# Altium project Main_Board.PrjPcb (part 27 of 44)

## Sheet RAM.SchDoc: RAM
size A3; Organization: PnP Systems Sp. z o.o.; Address1: Jasionka 954; Address2: 36-002  Jasionka, Poland; Address3: Phone: +48 17 773 69 10; Address4: e-mail: info@pnpsystems.com.pl
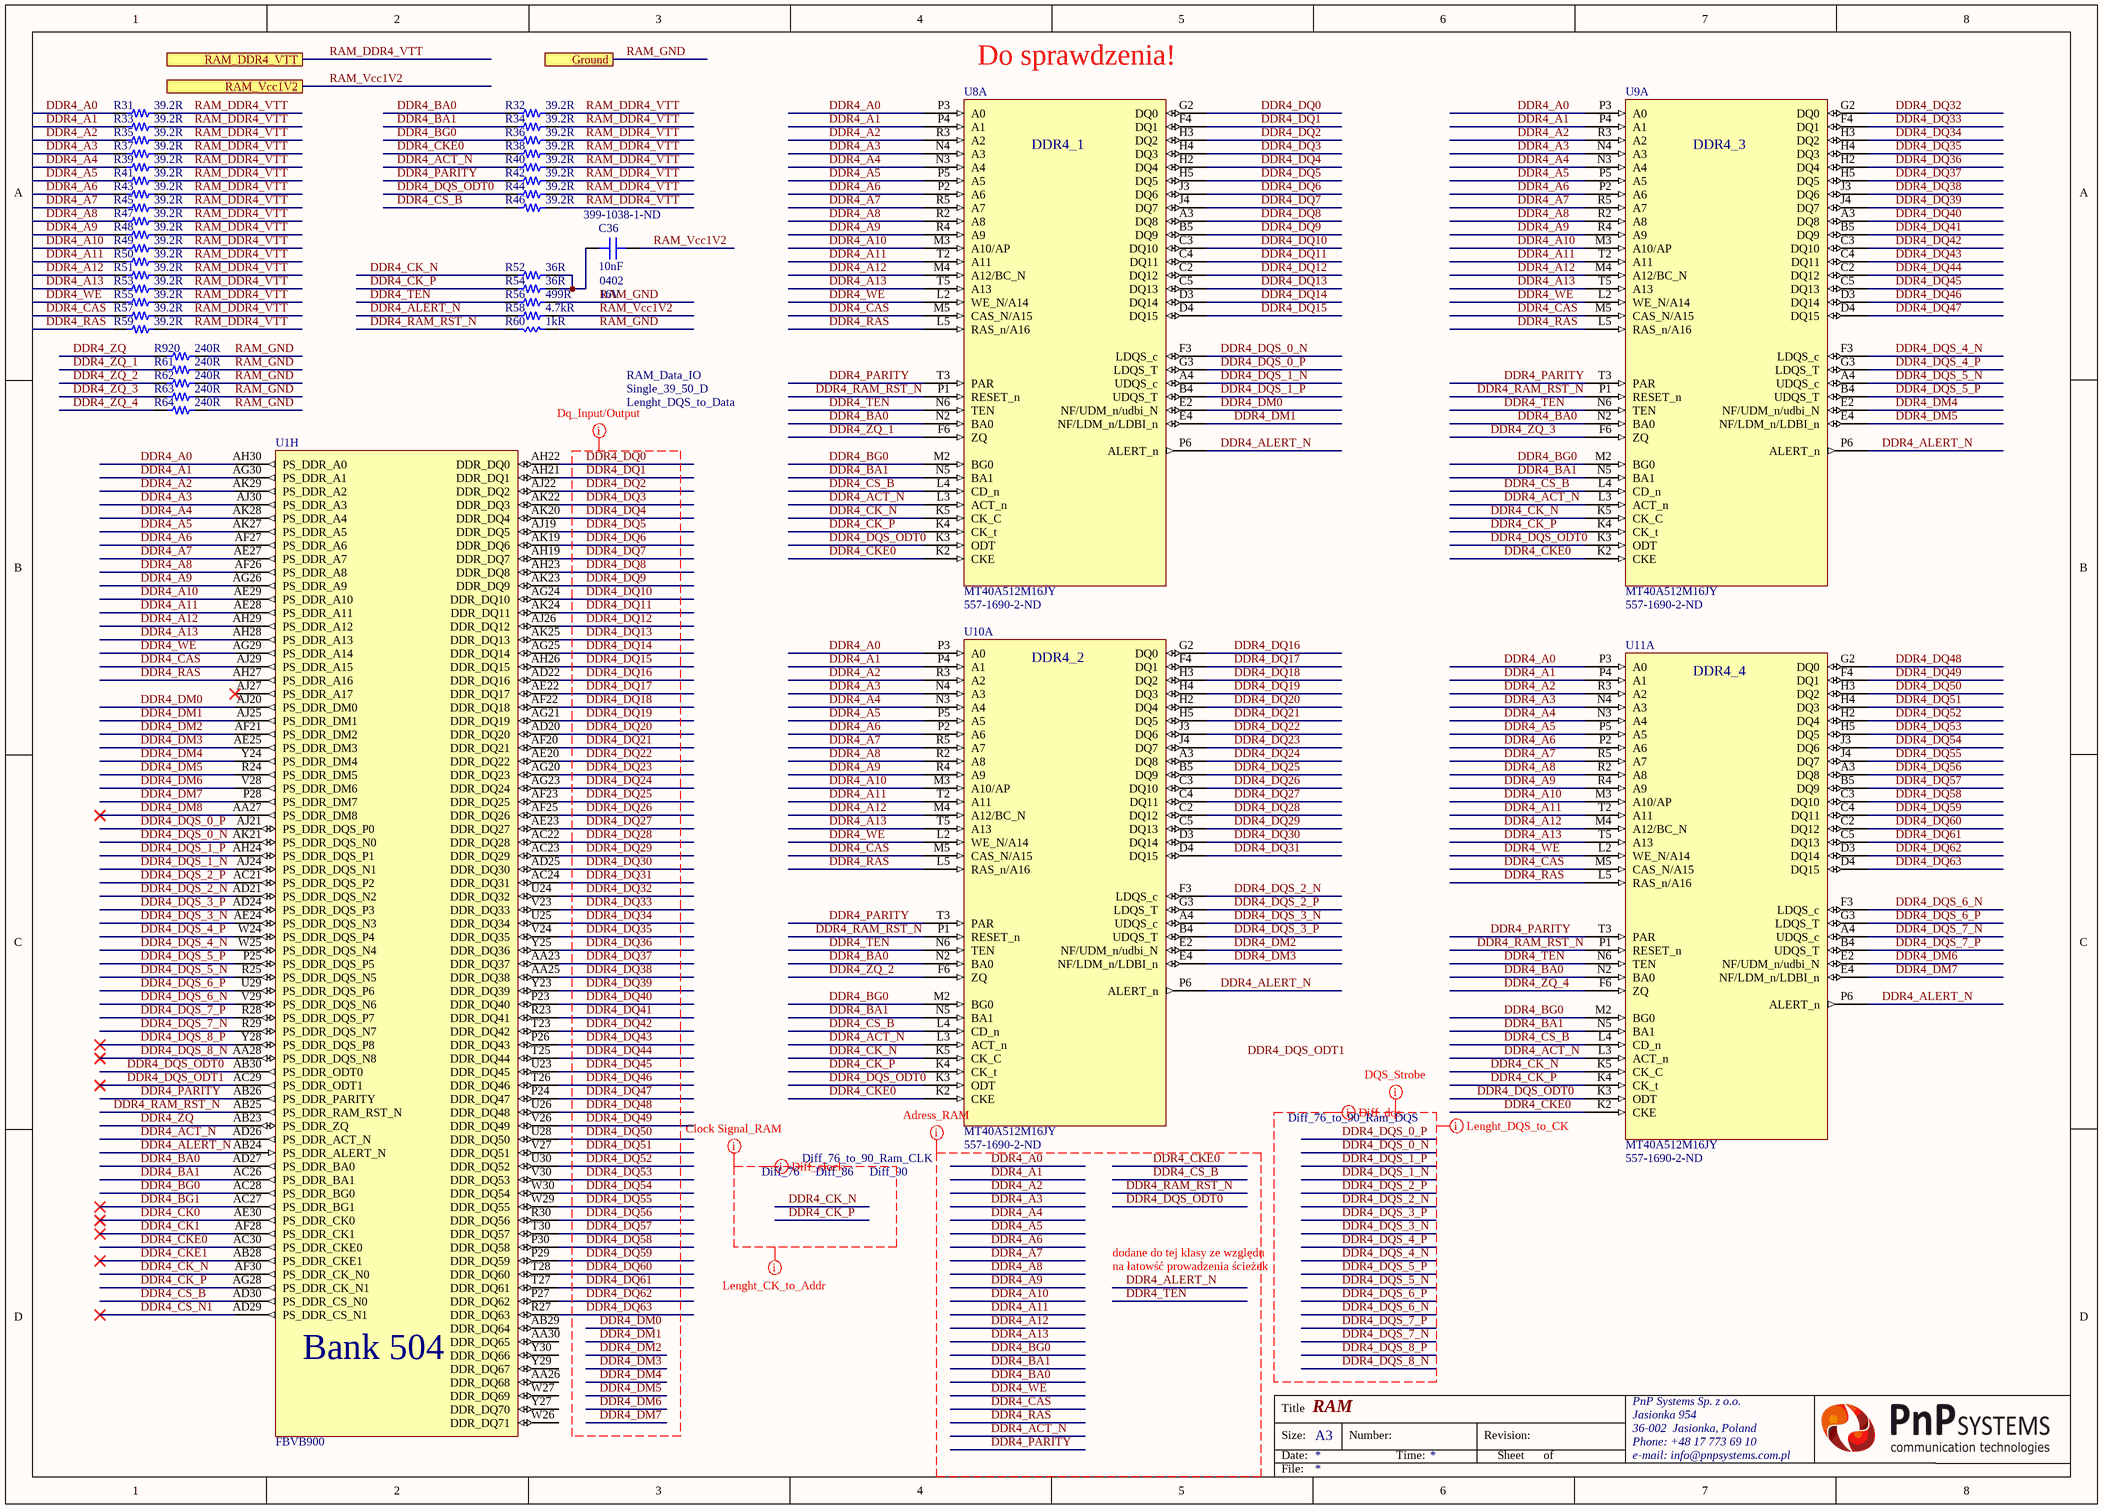
[diagram p37: RAM.SchDoc]

### Parts
C36  10nF  Supplier Part Number 1: 399-1038-1-ND  Case/Package: 0402  Voltage Rating (DC): 16V  [CAP 0402/1005 KK]
R31  39.2R  [RES 0402/1005 RF KK]
R32  39.2R  [RES 0402/1005 RF KK]
R33  39.2R  [RES 0402/1005 RF KK]
R34  39.2R  [RES 0402/1005 RF KK]
R35  39.2R  [RES 0402/1005 RF KK]
R36  39.2R  [RES 0402/1005 RF KK]
R37  39.2R  [RES 0402/1005 RF KK]
R38  39.2R  [RES 0402/1005 RF KK]
R39  39.2R  [RES 0402/1005 RF KK]
R40  39.2R  [RES 0402/1005 RF KK]
R41  39.2R  [RES 0402/1005 RF KK]
R42  39.2R  [RES 0402/1005 RF KK]
R43  39.2R  [RES 0402/1005 RF KK]
R44  39.2R  [RES 0402/1005 RF KK]
R45  39.2R  [RES 0402/1005 RF KK]
R46  39.2R  [RES 0402/1005 RF KK]
R47  39.2R  [RES 0402/1005 RF KK]
R48  39.2R  [RES 0402/1005 RF KK]
R49  39.2R  [RES 0402/1005 RF KK]
R50  39.2R  [RES 0402/1005 RF KK]
R51  39.2R  [RES 0402/1005 RF KK]
R52  36R  [RES 0402/1005 RF KK]
R53  39.2R  [RES 0402/1005 RF KK]
R54  36R  [RES 0402/1005 RF KK]
R55  39.2R  [RES 0402/1005 RF KK]
R56  499R  [RES 0402/1005 RF KK]
R57  39.2R  [RES 0402/1005 RF KK]
R58  4.7kR  [RES 0402/1005 RF KK]
R59  39.2R  [RES 0402/1005 RF KK]
R60  1kR  [RES 0402/1005 RF KK]
R61  240R  [RES 0402/1005 RF KK]
R62  240R  [RES 0402/1005 RF KK]
R63  240R  [RES 0402/1005 RF KK]
R64  240R  [RES 0402/1005 RF KK]
R920  240R  [RES 0402/1005 RF KK]
U1  FBVB900  [FBVB900 XX]  (part H of 23)
U8  MT40A512M16JY  Supplier Part Number 1: 557-1690-2-ND  [MT40A512M16JY]  (part A of 2)
U9  MT40A512M16JY  Supplier Part Number 1: 557-1690-2-ND  [MT40A512M16JY]  (part A of 2)
U10  MT40A512M16JY  Supplier Part Number 1: 557-1690-2-ND  [MT40A512M16JY]  (part A of 2)
U11  MT40A512M16JY  Supplier Part Number 1: 557-1690-2-ND  [MT40A512M16JY]  (part A of 2)

### Ports
Ground, RAM_DDR4_VTT, RAM_Vcc1V2

### Nets
RAM_GND: R56.2 R60.2 R61.2 R62.2 R63.2 R64.2 R920.2 ; port Ground  [project net B503_Ground]
DDR4_A0: R31.1 U1.AH30(PS_DDR_A0) U8.P3(A0) U9.P3(A0) U10.P3(A0) U11.P3(A0)
DDR4_A1: R33.1 U1.AG30(PS_DDR_A1) U8.P4(A1) U9.P4(A1) U10.P4(A1) U11.P4(A1)
DDR4_A2: R35.1 U1.AK29(PS_DDR_A2) U8.R3(A2) U9.R3(A2) U10.R3(A2) U11.R3(A2)
DDR4_A3: R37.1 U1.AJ30(PS_DDR_A3) U8.N4(A3) U9.N4(A3) U10.N4(A3) U11.N4(A3)
DDR4_A4: R39.1 U1.AK28(PS_DDR_A4) U8.N3(A4) U9.N3(A4) U10.N3(A4) U11.N3(A4)
DDR4_A5: R41.1 U1.AK27(PS_DDR_A5) U8.P5(A5) U9.P5(A5) U10.P5(A5) U11.P5(A5)
DDR4_A6: R43.1 U1.AF27(PS_DDR_A6) U8.P2(A6) U9.P2(A6) U10.P2(A6) U11.P2(A6)
DDR4_A7: R45.1 U1.AE27(PS_DDR_A7) U8.R5(A7) U9.R5(A7) U10.R5(A7) U11.R5(A7)
DDR4_A8: R47.1 U1.AF26(PS_DDR_A8) U8.R2(A8) U9.R2(A8) U10.R2(A8) U11.R2(A8)
DDR4_A9: R48.1 U1.AG26(PS_DDR_A9) U8.R4(A9) U9.R4(A9) U10.R4(A9) U11.R4(A9)
DDR4_A10: R49.1 U1.AE29(PS_DDR_A10) U8.M3(A10/AP) U9.M3(A10/AP) U10.M3(A10/AP) U11.M3(A10/AP)
DDR4_A11: R50.1 U1.AE28(PS_DDR_A11) U8.T2(A11) U9.T2(A11) U10.T2(A11) U11.T2(A11)
DDR4_A12: R51.1 U1.AH29(PS_DDR_A12) U8.M4(A12/BC_N) U9.M4(A12/BC_N) U10.M4(A12/BC_N) U11.M4(A12/BC_N)
DDR4_A13: R53.1 U1.AH28(PS_DDR_A13) U8.T5(A13) U9.T5(A13) U10.T5(A13) U11.T5(A13)
DDR4_ACT_N: R40.1 U1.AD26(PS_DDR_ACT_N) U8.L3(ACT_n) U9.L3(ACT_n) U10.L3(ACT_n) U11.L3(ACT_n)
DDR4_ALERT_N: R58.1 U1.AB24(PS_DDR_ALERT_N) U8.P6(ALERT_n) U9.P6(ALERT_n) U10.P6(ALERT_n) U11.P6(ALERT_n)
DDR4_BA0: R32.1 U1.AD27(PS_DDR_BA0) U8.N2(BA0) U9.N2(BA0) U10.N2(BA0) U11.N2(BA0)
DDR4_BA1: R34.1 U1.AC26(PS_DDR_BA1) U8.N5(BA1) U9.N5(BA1) U10.N5(BA1) U11.N5(BA1)
DDR4_BG0: R36.1 U1.AC28(PS_DDR_BG0) U8.M2(BG0) U9.M2(BG0) U10.M2(BG0) U11.M2(BG0)
DDR4_BG1: U1.AC27(PS_DDR_BG1)
DDR4_CAS: R57.1 U1.AJ29(PS_DDR_A15) U8.M5(CAS_N/A15) U9.M5(CAS_N/A15) U10.M5(CAS_N/A15) U11.M5(CAS_N/A15)
DDR4_CK0: U1.AE30(PS_DDR_CK0)
DDR4_CK1: U1.AF28(PS_DDR_CK1)
DDR4_CK_N: R52.1 U1.AF30(PS_DDR_CK_N0) U8.K5(CK_C) U9.K5(CK_C) U10.K5(CK_C) U11.K5(CK_C)
DDR4_CK_P: R54.1 U1.AG28(PS_DDR_CK_N1) U8.K4(CK_t) U9.K4(CK_t) U10.K4(CK_t) U11.K4(CK_t)
DDR4_CKE0: R38.1 U1.AC30(PS_DDR_CKE0) U8.K2(CKE) U9.K2(CKE) U10.K2(CKE) U11.K2(CKE)
DDR4_CKE1: U1.AB28(PS_DDR_CKE1)
DDR4_CS_B: R46.1 U1.AD30(PS_DDR_CS_N0) U8.L4(CD_n) U9.L4(CD_n) U10.L4(CD_n) U11.L4(CD_n)
DDR4_CS_N1: U1.AD29(PS_DDR_CS_N1)
DDR4_DM0: U1.AJ20(PS_DDR_DM0) U8.E2(NF/UDM_n/udbi_N)
DDR4_DM1: U1.AJ25(PS_DDR_DM1) U8.E4(NF/LDM_n/LDBI_n)
DDR4_DM2: U1.AF21(PS_DDR_DM2) U10.E2(NF/UDM_n/udbi_N)
DDR4_DM3: U1.AE25(PS_DDR_DM3) U10.E4(NF/LDM_n/LDBI_n)
DDR4_DM4: U1.Y24(PS_DDR_DM4) U9.E2(NF/UDM_n/udbi_N)
DDR4_DM5: U1.R24(PS_DDR_DM5) U9.E4(NF/LDM_n/LDBI_n)
DDR4_DM6: U1.V28(PS_DDR_DM6) U11.E2(NF/UDM_n/udbi_N)
DDR4_DM7: U1.P28(PS_DDR_DM7) U11.E4(NF/LDM_n/LDBI_n)
DDR4_DM8: U1.AA27(PS_DDR_DM8)
DDR4_DQ0: U1.AH22(DDR_DQ0) U8.G2(DQ0)
DDR4_DQ1: U1.AH21(DDR_DQ1) U8.F4(DQ1)
DDR4_DQ2: U1.AJ22(DDR_DQ2) U8.H3(DQ2)
DDR4_DQ3: U1.AK22(DDR_DQ3) U8.H4(DQ3)
DDR4_DQ4: U1.AK20(DDR_DQ4) U8.H2(DQ4)
DDR4_DQ5: U1.AJ19(DDR_DQ5) U8.H5(DQ5)
DDR4_DQ6: U1.AK19(DDR_DQ6) U8.J3(DQ6)
DDR4_DQ7: U1.AH19(DDR_DQ7) U8.J4(DQ7)
DDR4_DQ8: U1.AH23(DDR_DQ8) U8.A3(DQ8)
DDR4_DQ9: U1.AK23(DDR_DQ9) U8.B5(DQ9)
DDR4_DQ10: U1.AG24(DDR_DQ10) U8.C3(DQ10)
DDR4_DQ11: U1.AK24(DDR_DQ11) U8.C4(DQ11)
DDR4_DQ12: U1.AJ26(DDR_DQ12) U8.C2(DQ12)
DDR4_DQ13: U1.AK25(DDR_DQ13) U8.C5(DQ13)
DDR4_DQ14: U1.AG25(DDR_DQ14) U8.D3(DQ14)
DDR4_DQ15: U1.AH26(DDR_DQ15) U8.D4(DQ15)
DDR4_DQ16: U1.AD22(DDR_DQ16) U10.G2(DQ0)
DDR4_DQ17: U1.AE22(DDR_DQ17) U10.F4(DQ1)
DDR4_DQ18: U1.AF22(DDR_DQ18) U10.H3(DQ2)
DDR4_DQ19: U1.AG21(DDR_DQ19) U10.H4(DQ3)
DDR4_DQ20: U1.AD20(DDR_DQ20) U10.H2(DQ4)
DDR4_DQ21: U1.AF20(DDR_DQ21) U10.H5(DQ5)
DDR4_DQ22: U1.AE20(DDR_DQ22) U10.J3(DQ6)
DDR4_DQ23: U1.AG20(DDR_DQ23) U10.J4(DQ7)
DDR4_DQ24: U1.AG23(DDR_DQ24) U10.A3(DQ8)
DDR4_DQ25: U1.AF23(DDR_DQ25) U10.B5(DQ9)
DDR4_DQ26: U1.AF25(DDR_DQ26) U10.C3(DQ10)
DDR4_DQ27: U1.AE23(DDR_DQ27) U10.C4(DQ11)
DDR4_DQ28: U1.AC22(DDR_DQ28) U10.C2(DQ12)
DDR4_DQ29: U1.AC23(DDR_DQ29) U10.C5(DQ13)
DDR4_DQ30: U1.AD25(DDR_DQ30) U10.D3(DQ14)
DDR4_DQ31: U1.AC24(DDR_DQ31) U10.D4(DQ15)
DDR4_DQ32: U1.U24(DDR_DQ32) U9.G2(DQ0)
DDR4_DQ33: U1.V23(DDR_DQ33) U9.F4(DQ1)
DDR4_DQ34: U1.U25(DDR_DQ34) U9.H3(DQ2)
DDR4_DQ35: U1.V24(DDR_DQ35) U9.H4(DQ3)
DDR4_DQ36: U1.Y25(DDR_DQ36) U9.H2(DQ4)
DDR4_DQ37: U1.AA23(DDR_DQ37) U9.H5(DQ5)
DDR4_DQ38: U1.AA25(DDR_DQ38) U9.J3(DQ6)
DDR4_DQ39: U1.Y23(DDR_DQ39) U9.J4(DQ7)
DDR4_DQ40: U1.P23(DDR_DQ40) U9.A3(DQ8)
DDR4_DQ41: U1.R23(DDR_DQ41) U9.B5(DQ9)
DDR4_DQ42: U1.T23(DDR_DQ42) U9.C3(DQ10)
DDR4_DQ43: U1.P26(DDR_DQ43) U9.C4(DQ11)
DDR4_DQ44: U1.T25(DDR_DQ44) U9.C2(DQ12)
DDR4_DQ45: U1.U23(DDR_DQ45) U9.C5(DQ13)
DDR4_DQ46: U1.T26(DDR_DQ46) U9.D3(DQ14)
DDR4_DQ47: U1.P24(DDR_DQ47) U9.D4(DQ15)
DDR4_DQ48: U1.U26(DDR_DQ48) U11.G2(DQ0)
DDR4_DQ49: U1.V26(DDR_DQ49) U11.F4(DQ1)
DDR4_DQ50: U1.U28(DDR_DQ50) U11.H3(DQ2)
DDR4_DQ51: U1.V27(DDR_DQ51) U11.H4(DQ3)
DDR4_DQ52: U1.U30(DDR_DQ52) U11.H2(DQ4)
DDR4_DQ53: U1.V30(DDR_DQ53) U11.H5(DQ5)
DDR4_DQ54: U1.W30(DDR_DQ54) U11.J3(DQ6)
DDR4_DQ55: U1.W29(DDR_DQ55) U11.J4(DQ7)
DDR4_DQ56: U1.R30(DDR_DQ56) U11.A3(DQ8)
DDR4_DQ57: U1.T30(DDR_DQ57) U11.B5(DQ9)
DDR4_DQ58: U1.P30(DDR_DQ58) U11.C3(DQ10)
DDR4_DQ59: U1.P29(DDR_DQ59) U11.C4(DQ11)
DDR4_DQ60: U1.T28(DDR_DQ60) U11.C2(DQ12)
DDR4_DQ61: U1.T27(DDR_DQ61) U11.C5(DQ13)
DDR4_DQ62: U1.P27(DDR_DQ62) U11.D3(DQ14)
DDR4_DQ63: U1.R27(DDR_DQ63) U11.D4(DQ15)
DDR4_DQS_0_N: U1.AK21(PS_DDR_DQS_N0) U8.F3(LDQS_c)
DDR4_DQS_0_P: U1.AJ21(PS_DDR_DQS_P0) U8.G3(LDQS_T)
DDR4_DQS_1_N: U1.AJ24(PS_DDR_DQS_N1) U8.A4(UDQS_c)
DDR4_DQS_1_P: U1.AH24(PS_DDR_DQS_P1) U8.B4(UDQS_T)
DDR4_DQS_2_N: U1.AD21(PS_DDR_DQS_N2) U10.F3(LDQS_c)
DDR4_DQS_2_P: U1.AC21(PS_DDR_DQS_P2) U10.G3(LDQS_T)
DDR4_DQS_3_N: U1.AE24(PS_DDR_DQS_N3) U10.A4(UDQS_c)
DDR4_DQS_3_P: U1.AD24(PS_DDR_DQS_P3) U10.B4(UDQS_T)
DDR4_DQS_4_N: U1.W25(PS_DDR_DQS_N4) U9.F3(LDQS_c)
DDR4_DQS_4_P: U1.W24(PS_DDR_DQS_P4) U9.G3(LDQS_T)
DDR4_DQS_5_N: U1.R25(PS_DDR_DQS_N5) U9.A4(UDQS_c)
DDR4_DQS_5_P: U1.P25(PS_DDR_DQS_P5) U9.B4(UDQS_T)
DDR4_DQS_6_N: U1.V29(PS_DDR_DQS_N6) U11.F3(LDQS_c)
DDR4_DQS_6_P: U1.U29(PS_DDR_DQS_P6) U11.G3(LDQS_T)
DDR4_DQS_7_N: U1.R29(PS_DDR_DQS_N7) U11.A4(UDQS_c)
DDR4_DQS_7_P: U1.R28(PS_DDR_DQS_P7) U11.B4(UDQS_T)
DDR4_DQS_8_N: U1.AA28(PS_DDR_DQS_N8)
DDR4_DQS_8_P: U1.Y28(PS_DDR_DQS_P8)
DDR4_DQS_ODT0: R44.1 U1.AB30(PS_DDR_ODT0) U8.K3(ODT) U9.K3(ODT) U10.K3(ODT) U11.K3(ODT)
DDR4_DQS_ODT1: U1.AC29(PS_DDR_ODT1)
DDR4_PARITY: R42.1 U1.AB26(PS_DDR_PARITY) U8.T3(PAR) U9.T3(PAR) U10.T3(PAR) U11.T3(PAR)
DDR4_RAM_RST_N: R60.1 U1.AB25(PS_DDR_RAM_RST_N) U8.P1(RESET_n) U9.P1(RESET_n) U10.P1(RESET_n) U11.P1(RESET_n)
DDR4_RAS: R59.1 U1.AH27(PS_DDR_A16) U8.L5(RAS_n/A16) U9.L5(RAS_n/A16) U10.L5(RAS_n/A16) U11.L5(RAS_n/A16)
DDR4_TEN: R56.1 U8.N6(TEN) U9.N6(TEN) U10.N6(TEN) U11.N6(TEN)
DDR4_WE: R55.1 U1.AG29(PS_DDR_A14) U8.L2(WE_N/A14) U9.L2(WE_N/A14) U10.L2(WE_N/A14) U11.L2(WE_N/A14)
DDR4_ZQ: R920.1 U1.AB23(PS_DDR_ZQ)
DDR4_ZQ_1: R61.1 U8.F6(ZQ)
DDR4_ZQ_2: R62.1 U10.F6(ZQ)
DDR4_ZQ_3: R63.1 U9.F6(ZQ)
DDR4_ZQ_4: R64.1 U11.F6(ZQ)
RAM_DDR4_VTT: R31.2 R32.2 R33.2 R34.2 R35.2 R36.2 R37.2 R38.2 R39.2 R40.2 R41.2 R42.2 R43.2 R44.2 R45.2 R46.2 R47.2 R48.2 R49.2 R50.2 R51.2 R53.2 R55.2 R57.2 R59.2 ; port RAM_DDR4_VTT
RAM_Vcc1V2: C36.2 R58.2 ; port RAM_Vcc1V2
NetC36_1: C36.1 R52.2 R54.2

Not connected (* = marked no-connect by the designer): U1 AA26(DDR_DQ68) AA30(DDR_DQ65) AB29(DDR_DQ64) AJ27(PS_DDR_A17)* W26(DDR_DQ71) W27(DDR_DQ69) Y27(DDR_DQ70) Y29(DDR_DQ67) Y30(DDR_DQ66)

### Layout directives
net class RAM_Clock_Signal: DDR4_CK_N, DDR4_CK_P
differential pair; differential pair class Diff_76_to_90_Ram_CLK; differential pair class Diff_76; differential pair class Diff_86; differential pair class Diff_90: DDR4_CK_N, DDR4_CK_P
net class Single_36_39_50_Adr; net class RAM_Adress: DDR4_A0, DDR4_A1, DDR4_A2, DDR4_A3, DDR4_A4, DDR4_A5, DDR4_A6, DDR4_A7, DDR4_A8, DDR4_A9, DDR4_A10, DDR4_A11, DDR4_A12, DDR4_A13, DDR4_ACT_N, DDR4_ALERT_N, DDR4_BA0, DDR4_BA1, DDR4_BG0, DDR4_CAS, DDR4_CKE0, DDR4_CS_B, DDR4_DQS_ODT0, DDR4_PARITY, DDR4_RAM_RST_N, DDR4_RAS, DDR4_TEN, DDR4_WE
net class Diff_76_86_90; net class RAM_DQS_Strobe: DDR4_DQS_0_N, DDR4_DQS_0_P, DDR4_DQS_1_N, DDR4_DQS_1_P, DDR4_DQS_2_N, DDR4_DQS_2_P, DDR4_DQS_3_N, DDR4_DQS_3_P, DDR4_DQS_4_N, DDR4_DQS_4_P, DDR4_DQS_5_N, DDR4_DQS_5_P, DDR4_DQS_6_N, DDR4_DQS_6_P, DDR4_DQS_7_N, DDR4_DQS_7_P, DDR4_DQS_8_N, DDR4_DQS_8_P
net class Single_39_50_D; net class RAM_Data_IO; net class Lenght_DQS_to_Data: DDR4_DM0, DDR4_DM1, DDR4_DM2, DDR4_DM3, DDR4_DM4, DDR4_DM5, DDR4_DM6, DDR4_DM7, DDR4_DQ0, DDR4_DQ1, DDR4_DQ2, DDR4_DQ3, DDR4_DQ4, DDR4_DQ5, DDR4_DQ6, DDR4_DQ7, DDR4_DQ8, DDR4_DQ9, DDR4_DQ10, DDR4_DQ11, DDR4_DQ12, DDR4_DQ13, DDR4_DQ14, DDR4_DQ15, DDR4_DQ16, DDR4_DQ17, DDR4_DQ18, DDR4_DQ19, DDR4_DQ20, DDR4_DQ21, DDR4_DQ22, DDR4_DQ23, DDR4_DQ24, DDR4_DQ25, DDR4_DQ26, DDR4_DQ27, DDR4_DQ28, DDR4_DQ29, DDR4_DQ30, DDR4_DQ31, DDR4_DQ32, DDR4_DQ33, DDR4_DQ34, DDR4_DQ35, DDR4_DQ36, DDR4_DQ37, DDR4_DQ38, DDR4_DQ39, DDR4_DQ40, DDR4_DQ41, DDR4_DQ42, DDR4_DQ43, DDR4_DQ44, DDR4_DQ45, DDR4_DQ46, DDR4_DQ47, DDR4_DQ48, DDR4_DQ49, DDR4_DQ50, DDR4_DQ51, DDR4_DQ52, DDR4_DQ53, DDR4_DQ54, DDR4_DQ55, DDR4_DQ56, DDR4_DQ57, DDR4_DQ58, DDR4_DQ59, DDR4_DQ60, DDR4_DQ61, DDR4_DQ62, DDR4_DQ63
differential pair; differential pair class Diff_76_to_90_Ram_DQS: DDR4_DQS_0_N, DDR4_DQS_0_P, DDR4_DQS_1_N, DDR4_DQS_1_P, DDR4_DQS_2_N, DDR4_DQS_2_P, DDR4_DQS_3_N, DDR4_DQS_3_P, DDR4_DQS_4_N, DDR4_DQS_4_P, DDR4_DQS_5_N, DDR4_DQS_5_P, DDR4_DQS_6_N, DDR4_DQS_6_P, DDR4_DQS_7_N, DDR4_DQS_7_P, DDR4_DQS_8_N, DDR4_DQS_8_P
net class Lenght_CK_to_Addr: DDR4_CK_N, DDR4_CK_P
net class Lenght_DQS_to_CK: DDR4_DQS_0_N, DDR4_DQS_0_P, DDR4_DQS_1_N, DDR4_DQS_1_P, DDR4_DQS_2_N, DDR4_DQS_2_P, DDR4_DQS_3_N, DDR4_DQS_3_P, DDR4_DQS_4_N, DDR4_DQS_4_P, DDR4_DQS_5_N, DDR4_DQS_5_P, DDR4_DQS_6_N, DDR4_DQS_6_P, DDR4_DQS_7_N, DDR4_DQS_7_P, DDR4_DQS_8_N, DDR4_DQS_8_P

### Notes on the sheet
- (near U8) Do sprawdzenia!
- (near U8) DDR4_1
- (near U9) DDR4_3
- (near U10) DDR4_2
- (near U11) DDR4_4
- dodane do tej klasy ze względu
- na łatowść prowadzenia ścieżek
- Labels drawn without touching a wire or pin: DDR4_DQS_ODT1
- Title
- Size:
- Date:
- A3
- Number:
- Time:
- Revision:
- Sheet
- of
- File:
- (in symbol FBVB900, part H) Bank 504

### Library data of the parts
C36 = Capacitor: Manufacturer: KEMET; Manufacturer Part Number: C0402C103K4RACTU; Dielectric Material: Ceramic; Tolerance: 10%; Dielectric: X7R; Dissipation Factor: 3.5%; Supplier 1: Digi-Key; Stock 1: 1112674; Pricing 1: 1 = 0,10000, 10 = 0,02800, 100 = 0,01240, 500 = 0,00886, 1000 = 0,00696, 2500 = 0,00632, 5000 = 0,00582 (USD); RoHS: Yes; Mount: Surface Mount,PCB; Number of Pins: 2; Case Code (Metric): 1005; Case Code (Imperial): 0402; Contact Plating: Tin,Matte; Min Operating Temperature: -55°C; Max Operating Temperature: 125°C; Capacitance: 10nF; Packaging: Tape and Reel; Package Quantity: 1; Voltage Rating: 16V; Termination: SMD/SMT; Voltage: 16V; Length: 1mm; Height: 0.5mm; Width: 0.02inch; Depth: 0.5mm; Thickness: 0.022inch; Lead Pitch: 0.3mm; Radiation Hardening: No; REACH SVHC: No SVHC; ComponentLink1URL: https://datasheet.ciiva.com/14595/70095383-14595321.pdf?src-supplier=Allied+Electronics; ComponentLink1Description: https://datasheet.ciiva.com/14595/70095383-14595321.pdf?src-supplier=Allied+Electronics; ComponentLink2URL: https://datasheet.ciiva.com/7747/kem-c1002-x7r-smd-7747614.pdf?src-supplier=Element14; ComponentLink2Description: https://datasheet.ciiva.com/7747/kem-c1002-x7r-smd-7747614.pdf?src-supplier=Element14
R31-R51 R53 R55 R57 R59 = Resistor: Manufacturer: Panasonic; Manufacturer Part Number: ERJ-2RKF39R2X; Tolerance: 1%; Temperature Coefficient: 100ppm/°C; Power Rating: 100mW; Voltage Rating: 50V; Supplier 1: Digi-Key; Supplier Part Number 1: P39.2LCT-ND; Stock 1: 158875; Pricing 1: 1 = 0,10000, 10 = 0,04500, 100 = 0,01830, 1000 = 0,00823, 2500 = 0,00715, 5000 = 0,00590 (USD); RoHS: Yes; Mount: Surface Mount; Case/Package: 0402; Case Code (Metric): 1005; Case Code (Imperial): 0402; Contact Plating: Tin; Min Operating Temperature: -55°C; Max Operating Temperature: 155°C; Packaging: Tape and Reel; Resistance: 39.2R; Composition: Thick Film; Number of Terminations: 2; Termination: SMD/SMT; Max Power Dissipation: 100mW; Package Quantity: 1; Military Standard: Not; Voltage Rating (DC): 50V; Features: Automotive AEC-Q200; Length: 1mm; Height: 0.35mm; Width: 0.02inch; Depth: 0.5mm; Radiation Hardening: No; Lead Free: Lead Free; REACH SVHC: No SVHC; ComponentLink1URL: https://datasheet.ciiva.com/7943/aoa0000ce2-7943669.pdf?src-supplier=Element14; ComponentLink1Description: https://datasheet.ciiva.com/7943/aoa0000ce2-7943669.pdf?src-supplier=Element14; ComponentLink2URL: https://datasheet.ciiva.com/22667/1678782-22667733.pdf?src-supplier=Element14; ComponentLink2Description: https://datasheet.ciiva.com/22667/1678782-22667733.pdf?src-supplier=Element14; ComponentLink3URL: https://datasheet.ciiva.com/16760/70260748-16760342.pdf?src-supplier=Allied+Electronics; ComponentLink3Description: https://datasheet.ciiva.com/16760/70260748-16760342.pdf?src-supplier=Allied+Electronics; ComponentLink4URL: https://datasheet.ciiva.com/9189/aoa0000ce2-9189912.pdf?src-supplier=Avnet; ComponentLink4Description: https://datasheet.ciiva.com/9189/aoa0000ce2-9189912.pdf?src-supplier=Avnet; ComponentLink5URL: https://datasheet.ciiva.com/16773/70260748-16773948.pdf?src-supplier=Allied+Electronics; ComponentLink5Description: https://datasheet.ciiva.com/16773/70260748-16773948.pdf?src-supplier=Allied+Electronics; ComponentLink6URL: https://datasheet.ciiva.com/24068/aoa0000ce2-24068813.pdf?src-supplier=Mouser; ComponentLink6Description: https://datasheet.ciiva.com/24068/aoa0000ce2-24068813.pdf?src-supplier=Mouser; ComponentLink7URL: https://datasheet.ciiva.com/43467/1678782-43467181.pdf?src-supplier=Farnell; ComponentLink7Description: https://datasheet.ciiva.com/43467/1678782-43467181.pdf?src-supplier=Farnell; ComponentLink8URL: https://datasheet.ciiva.com/46372/1678782-46372671.pdf?src-supplier=Element14; ComponentLink8Description: https://datasheet.ciiva.com/46372/1678782-46372671.pdf?src-supplier=Element14
R52 R54 = Resistor: Manufacturer: Panasonic; Manufacturer Part Number: ERJ-2RKF36R0X; Tolerance: 1%; Temperature Coefficient: 100ppm/°C; Power Rating: 100mW; Voltage Rating: 50V; Supplier 1: Digi-Key; Supplier Part Number 1: P36.0LCT-ND; Stock 1: 324893; Pricing 1: 1 = 0,10000, 10 = 0,05300, 100 = 0,02170, 1000 = 0,00973, 2500 = 0,00844, 5000 = 0,00698 (USD); RoHS: Yes; Mount: Surface Mount; Case/Package: 0402; Case Code (Metric): 1005; Case Code (Imperial): 0402; Contact Plating: Tin; Min Operating Temperature: -55°C; Max Operating Temperature: 155°C; Resistance: 36R; Packaging: Tape and Reel; Composition: Thick Film; Voltage Rating (DC): 50V; Number of Terminations: 2; Package Quantity: 10000; Max Power Dissipation: 100mW; Termination: SMD/SMT; Length: 1mm; Height: 0.35mm; Width: 0.02inch; Depth: 0.5mm; REACH SVHC: No SVHC; ComponentLink1URL: https://datasheet.ciiva.com/11821/0900766b80f80784-11821284.pdf?src-supplier=RSComponents; ComponentLink1Description: https://datasheet.ciiva.com/11821/0900766b80f80784-11821284.pdf?src-supplier=RSComponents; ComponentLink2URL: https://datasheet.ciiva.com/46372/1678782-46372805.pdf?src-supplier=Element14; ComponentLink2Description: https://datasheet.ciiva.com/46372/1678782-46372805.pdf?src-supplier=Element14; ComponentLink3URL: https://datasheet.ciiva.com/24027/aoa0000ce2-24027143.pdf?src-supplier=Mouser; ComponentLink3Description: https://datasheet.ciiva.com/24027/aoa0000ce2-24027143.pdf?src-supplier=Mouser; ComponentLink4URL: https://datasheet.ciiva.com/22667/1678782-22667977.pdf?src-supplier=Element14; ComponentLink4Description: https://datasheet.ciiva.com/22667/1678782-22667977.pdf?src-supplier=Element14; ComponentLink5URL: https://datasheet.ciiva.com/43467/1678782-43467177.pdf?src-supplier=Farnell; ComponentLink5Description: https://datasheet.ciiva.com/43467/1678782-43467177.pdf?src-supplier=Farnell; ComponentLink6URL: https://datasheet.ciiva.com/9190/aoa0000ce2-9190202.pdf?src-supplier=Avnet; ComponentLink6Description: https://datasheet.ciiva.com/9190/aoa0000ce2-9190202.pdf?src-supplier=Avnet; ComponentLink7URL: https://datasheet.ciiva.com/22721/1678782-22721246.pdf?src-supplier=Farnell; ComponentLink7Description: https://datasheet.ciiva.com/22721/1678782-22721246.pdf?src-supplier=Farnell
R56 = Resistor: Resistor;  Thick Film;  Res 499 Ohms;  Pwr-Rtg 0.1 W;  Tol 1%;  SMT;  0402;  Tape & Reel; Manufacturer: Panasonic; Manufacturer Part Number: ERJ-2RKF4990X; Power Rating: 100mW; Voltage Rating: 50V; Temperature Coefficient: 100ppm/°C; Supplier 1: Digi-Key; Supplier Part Number 1: P499LCT-ND; RoHS: Yes; Category: Chip SMD Resistors; Stock 1: 4560116; Pricing 1: 1=0,10000, 10=0,04100, 100=0,01670, 1000=0,00751, 2500=0,00652, 5000=0,00538 (USD); Mount: Surface Mount; Case/Package: 0402; Case Code (Metric): 1005; Case Code (Imperial): 0402; Contact Plating: Tin; Min Operating Temperature: -55°C; Max Operating Temperature: 155°C; Resistance: 499R; Tolerance: 1%; Packaging: Tape and Reel; Package Quantity: 1; Composition: Thick Film; Number of Terminations: 2; Termination: SMD/SMT; Military Standard: Not; Max Power Dissipation: 100mW; Voltage Rating (DC): 50V; Features: Automotive AEC-Q200; Length: 1mm; Height: 0.35mm; Width: 0.02inch; Depth: 0.5mm; REACH SVHC: No SVHC; Lead Free: Lead Free; ComponentLink1URL: https://datasheet.ciiva.com/9181/aoa0000ce2-9181461.pdf?src-supplier=Avnet; ComponentLink1Description: https://datasheet.ciiva.com/9181/aoa0000ce2-9181461.pdf?src-supplier=Avnet; ComponentLink2URL: https://datasheet.ciiva.com/28695/1678782-28695781.pdf?src-supplier=Element14; ComponentLink2Description: https://datasheet.ciiva.com/28695/1678782-28695781.pdf?src-supplier=Element14; ComponentLink3URL: https://datasheet.ciiva.com/6201/426256-6201373.pdf?src-supplier=Farnell; ComponentLink3Description: https://datasheet.ciiva.com/6201/426256-6201373.pdf?src-supplier=Farnell; ComponentLink4URL: https://datasheet.ciiva.com/16508/aoa0000ce2-16508382.pdf?src-supplier=Future+Electronics; ComponentLink4Description: https://datasheet.ciiva.com/16508/aoa0000ce2-16508382.pdf?src-supplier=Future+Electronics; ComponentLink5URL: https://datasheet.ciiva.com/16765/70260748-16765054.pdf?src-supplier=Allied+Electronics; ComponentLink5Description: https://datasheet.ciiva.com/16765/70260748-16765054.pdf?src-supplier=Allied+Electronics; ComponentLink6URL: https://datasheet.ciiva.com/22749/1678782-22749610.pdf?src-supplier=Element14; ComponentLink6Description: https://datasheet.ciiva.com/22749/1678782-22749610.pdf?src-supplier=Element14; ComponentLink7URL: https://datasheet.ciiva.com/46377/426256-46377550.pdf?src-supplier=Element14; ComponentLink7Description: https://datasheet.ciiva.com/46377/426256-46377550.pdf?src-supplier=Element14
R58 = Resistor: as R276 on sheet XilinxPower; Supplier 1: Digi-Key; Supplier Part Number 1: P4.70KLCT-ND; Stock 1: 5361977; Pricing 1: 1 = 0,10000, 10 = 0,05500, 100 = 0,02250, 1000 = 0,01009, 2500 = 0,00876, 5000 = 0,00724 (USD); RoHS: Yes; Mount: Surface Mount; Case/Package: 0402; Number of Pins: 2; Case Code (Imperial): 0402; Case Code (Metric): 1005; Contact Plating: Tin; Min Operating Temperature: -55°C; Max Operating Temperature: 155°C; Resistance: 4.7kR; Packaging: Tape and Reel; Composition: Thick Film; Package Quantity: 1; Termination: SMD/SMT; Voltage Rating (DC): 50V; Number of Terminations: 2; Military Standard: Not; Max Power Dissipation: 100mW; Features: Automotive AEC-Q200; Length: 1mm; Height: 0.35mm; Width: 0.02inch; Depth: 0.5mm; Radiation Hardening: No; Lead Free: Lead Free; REACH SVHC: No SVHC; ComponentLink1URL: https://datasheet.ciiva.com/11821/0900766b80f80784-11821329.pdf?src-supplier=RSComponents; ComponentLink1Description: https://datasheet.ciiva.com/11821/0900766b80f80784-11821329.pdf?src-supplier=RSComponents; ComponentLink2URL: https://datasheet.ciiva.com/30053/aoa0000ce2-30053990.pdf?src-supplier=Onlinecomponents.com; ComponentLink2Description: https://datasheet.ciiva.com/30053/aoa0000ce2-30053990.pdf?src-supplier=Onlinecomponents.com; ComponentLink3URL: https://datasheet.ciiva.com/7830/aoa0000ce2-7830727.pdf?src-supplier=Element14; ComponentLink3Description: https://datasheet.ciiva.com/7830/aoa0000ce2-7830727.pdf?src-supplier=Element14; ComponentLink4URL: https://datasheet.ciiva.com/22781/1678782-22781576.pdf?src-supplier=Farnell; ComponentLink4Description: https://datasheet.ciiva.com/22781/1678782-22781576.pdf?src-supplier=Farnell; ComponentLink5URL: https://datasheet.ciiva.com/9195/aoa0000ce2-9195737.pdf?src-supplier=Avnet; ComponentLink5Description: https://datasheet.ciiva.com/9195/aoa0000ce2-9195737.pdf?src-supplier=Avnet; ComponentLink6URL: https://datasheet.ciiva.com/17213/aoa0000ce2-17213180.pdf?src-supplier=Avnet+Europe; ComponentLink6Description: https://datasheet.ciiva.com/17213/aoa0000ce2-17213180.pdf?src-supplier=Avnet+Europe; ComponentLink7URL: https://datasheet.ciiva.com/22667/1678782-22667886.pdf?src-supplier=Element14; ComponentLink7Description: https://datasheet.ciiva.com/22667/1678782-22667886.pdf?src-supplier=Element14; ComponentLink8URL: https://datasheet.ciiva.com/16763/70260748-16763151.pdf?src-supplier=Allied+Electronics; ComponentLink8Description: https://datasheet.ciiva.com/16763/70260748-16763151.pdf?src-supplier=Allied+Electronics; ComponentLink9URL: https://datasheet.ciiva.com/22723/1678782-22723903.pdf?src-supplier=Element14; ComponentLink9Description: https://datasheet.ciiva.com/22723/1678782-22723903.pdf?src-supplier=Element14; ComponentLink10URL: https://datasheet.ciiva.com/24025/aoa0000ce2-24025663.pdf?src-supplier=Mouser; ComponentLink10Description: https://datasheet.ciiva.com/24025/aoa0000ce2-24025663.pdf?src-supplier=Mouser
R60 = Resistor: PANASONIC - ERJ-2RKF1001X - SMD Chip Resistor, 0402 [1005 Metric], 1 kohm, ERJ2R Series, 50 V, Thick Film, 100 mW; Temperature Coefficient: 100ppm/°C; Tolerance: 1%; Voltage Rating (DC): 50V; Power Rating: 100mW; Supplier 1: Digi-Key; Supplier Part Number 1: P1.00KLDKR-ND; Manufacturer: Panasonic; Manufacturer Part Number: ERJ-2RKF1001X; RoHS: Yes; Category: Chip SMD Resistors; Stock 1: 1864188; Pricing 1: 1=0,10000, 10=0,04300, 100=0,01740, 1000=0,00782, 2500=0,00678, 5000=0,00561 (USD); Mount: Surface Mount; Case/Package: 0402; Number of Pins: 2; Contact Plating: Tin; Case Code (Imperial): 0402; Case Code (Metric): 1005; Min Operating Temperature: -55°C; Max Operating Temperature: 155°C; Composition: Thick Film; Resistance: 1kR; Termination: SMD/SMT; Number of Terminations: 2; Military Standard: Not; Features: Automotive AEC-Q200; Packaging: Tape and Reel; Voltage Rating: 50V; Package Quantity: 1; Max Power Dissipation: 100mW; Working Voltage: 50V; Length: 1mm; Height: 0.35mm; Depth: 0.5mm; Width: 0.5mm; Radiation Hardening: No; Lead Free: Lead Free; REACH SVHC: No SVHC; ComponentLink1URL: https://datasheet.ciiva.com/11821/0900766b80f80784-11821203.pdf?src-supplier=RSComponents; ComponentLink1Description: https://datasheet.ciiva.com/11821/0900766b80f80784-11821203.pdf?src-supplier=RSComponents; ComponentLink2URL: https://datasheet.ciiva.com/7942/aoa0000ce2-7942426.pdf?src-supplier=Element14; ComponentLink2Description: https://datasheet.ciiva.com/7942/aoa0000ce2-7942426.pdf?src-supplier=Element14; ComponentLink3URL: https://datasheet.ciiva.com/16523/aoa0000ce2-16523834.pdf?src-supplier=Avnet+Asia; ComponentLink3Description: https://datasheet.ciiva.com/16523/aoa0000ce2-16523834.pdf?src-supplier=Avnet+Asia; ComponentLink4URL: https://datasheet.ciiva.com/17215/aoa0000ce2-17215308.pdf?src-supplier=Avnet+Europe; ComponentLink4Description: https://datasheet.ciiva.com/17215/aoa0000ce2-17215308.pdf?src-supplier=Avnet+Europe; ComponentLink5URL: https://datasheet.ciiva.com/22673/1678782-22673916.pdf?src-supplier=Element14; ComponentLink5Description: https://datasheet.ciiva.com/22673/1678782-22673916.pdf?src-supplier=Element14; ComponentLink6URL: https://datasheet.ciiva.com/28532/1678782-28532109.pdf?src-supplier=Element14; ComponentLink6Description: https://datasheet.ciiva.com/28532/1678782-28532109.pdf?src-supplier=Element14; ComponentLink7URL: https://datasheet.ciiva.com/16767/70260748-16767559.pdf?src-supplier=Allied+Electronics; ComponentLink7Description: https://datasheet.ciiva.com/16767/70260748-16767559.pdf?src-supplier=Allied+Electronics; ComponentLink8URL: https://datasheet.ciiva.com/9198/aoa0000ce2-9198920.pdf?src-supplier=Avnet; ComponentLink8Description: https://datasheet.ciiva.com/9198/aoa0000ce2-9198920.pdf?src-supplier=Avnet; ComponentLink9URL: https://datasheet.ciiva.com/16771/70260748-16771979.pdf?src-supplier=Allied+Electronics; ComponentLink9Description: https://datasheet.ciiva.com/16771/70260748-16771979.pdf?src-supplier=Allied+Electronics
R61-R64 R920 = Resistor: Manufacturer: Vishay; Manufacturer Part Number: CRCW0402240RFKED; Tolerance: 1%; Power Rating: 63mW; Temperature Coefficient: 100ppm/°C; Voltage Rating: 50V; Supplier 1: Digi-Key; Supplier Part Number 1: 541-240LCT-ND; Stock 1: 21562; Pricing 1: 1 = 0,10000, 10 = 0,03800, 100 = 0,01540, 1000 = 0,00690, 2500 = 0,00599, 5000 = 0,00495 (USD); RoHS: Yes; Mount: Surface Mount; Case/Package: 0402; Weight: 2.3E-05oz; Case Code (Metric): 1005; Case Code (Imperial): 0402; Contact Plating: Tin; Min Operating Temperature: -55°C; Max Operating Temperature: 155°C; Resistance: 240R; Packaging: Tape and Reel; Composition: Thick Film; Termination: SMD/SMT; Package Quantity: 10; Number of Terminations: 2; Military Standard: Not; Max Power Dissipation: 63mW; Voltage Rating (DC): 50V; Features: Automotive AEC-Q200; Working Voltage: 50V; Length: 1mm; Height: 0.35mm; Width: 0.02inch; Depth: 0.5mm; Radiation Hardening: No; Lead Free: Lead Free; REACH SVHC: Unknown; ComponentLink1URL: https://datasheet.ciiva.com/11809/0900766b80d98824-11809853.pdf?src-supplier=RSComponents; ComponentLink1Description: https://datasheet.ciiva.com/11809/0900766b80d98824-11809853.pdf?src-supplier=RSComponents; ComponentLink2URL: https://datasheet.ciiva.com/16784/70201119-16784686.pdf?src-supplier=Allied+Electronics; ComponentLink2Description: https://datasheet.ciiva.com/16784/70201119-16784686.pdf?src-supplier=Allied+Electronics; ComponentLink3URL: https://datasheet.ciiva.com/16886/dcrcwe3-16886728.pdf?src-supplier=Avnet+Europe; ComponentLink3Description: https://datasheet.ciiva.com/16886/dcrcwe3-16886728.pdf?src-supplier=Avnet+Europe; ComponentLink4URL: https://datasheet.ciiva.com/2463/dcrcwe3-2463067.pdf?src-supplier=Digi-Key; ComponentLink4Description: https://datasheet.ciiva.com/2463/dcrcwe3-2463067.pdf?src-supplier=Digi-Key; ComponentLink5URL: https://datasheet.ciiva.com/2463/dcrcwe3-2463068.pdf?src-supplier=Digi-Key; ComponentLink5Description: https://datasheet.ciiva.com/2463/dcrcwe3-2463068.pdf?src-supplier=Digi-Key; ComponentLink6URL: https://datasheet.ciiva.com/2463/dcrcwe3-2463069.pdf?src-supplier=Digi-Key; ComponentLink6Description: https://datasheet.ciiva.com/2463/dcrcwe3-2463069.pdf?src-supplier=Digi-Key; ComponentLink7URL: https://datasheet.ciiva.com/8954/dcrcwe3-8954621.pdf?src-supplier=Avnet; ComponentLink7Description: https://datasheet.ciiva.com/8954/dcrcwe3-8954621.pdf?src-supplier=Avnet; ComponentLink8URL: https://datasheet.ciiva.com/16204/dcrcwe3-16204941.pdf?src-supplier=Future+Electronics; ComponentLink8Description: https://datasheet.ciiva.com/16204/dcrcwe3-16204941.pdf?src-supplier=Future+Electronics; ComponentLink9URL: https://datasheet.ciiva.com/5546/dcrcwe3-109170-5546510.pdf?src-supplier=Mouser; ComponentLink9Description: https://datasheet.ciiva.com/5546/dcrcwe3-109170-5546510.pdf?src-supplier=Mouser; ComponentLink10URL: https://datasheet.ciiva.com/16780/70201119-16780206.pdf?src-supplier=Allied+Electronics; ComponentLink10Description: https://datasheet.ciiva.com/16780/70201119-16780206.pdf?src-supplier=Allied+Electronics
U1 = FBVB900: as U1 on sheet XilinxPower; Supplier 1: Mouser; Supplier Part Number 1: 217-CZU4CG-1FBVB900E; Stock 1: 3; Pricing 1: 1=0,00000, 5=1060,70000 (USD); RoHS: No; Case/Package: FCBGA; Min Operating Temperature: 0°C; Max Operating Temperature: 100°C; Packaging: Tray; ComponentLink1URL: https://www.xilinx.com/support/documentation/data_sheets/ds891-zynq-ultrascale-plus-overview.pdf?src-supplier=Digi-Key; ComponentLink1Description: https://www.xilinx.com/support/documentation/data_sheets/ds891-zynq-ultrascale-plus-overview.pdf?src-supplier=Digi-Key; ComponentLink2URL: https://www.xilinx.com/support/documentation/data_sheets/ds925-zynq-ultrascale-plus.pdf?src-supplier=Digi-Key; ComponentLink2Description: https://www.xilinx.com/support/documentation/data_sheets/ds925-zynq-ultrascale-plus.pdf?src-supplier=Digi-Key; Supplier 2: Avnet; Supplier 3: Digi-Key; Supplier Part Number 2: XCZU4CG-1FBVB900E; Supplier Part Number 3: XCZU4CG-1FBVB900E-ND
U8-U11 = MT40A512M16JY: as U8 on sheet RAM_Power; Supplier 1: Digi-Key; Stock 1: 0; Pricing 1: 2000 = 12,80254 (USD); RoHS: Yes; Min Operating Temperature: -40°C; Max Operating Temperature: 95°C; ComponentLink1URL: https://www.micron.com/~/media/documents/products/data-sheet/dram/ddr4/8gb_ddr4_sdram.pdf?src-supplier=Digi-Key; ComponentLink1Description: https://www.micron.com/~/media/documents/products/data-sheet/dram/ddr4/8gb_ddr4_sdram.pdf?src-supplier=Digi-Key

## Sheet Ground.SchDoc: Minus komponentow
size A3; Organization: Altium Limited; Address1: L3, 12a Rodborough Rd; Address2: Frenchs Forest; Address3: NSW; Address4: Australia 2086
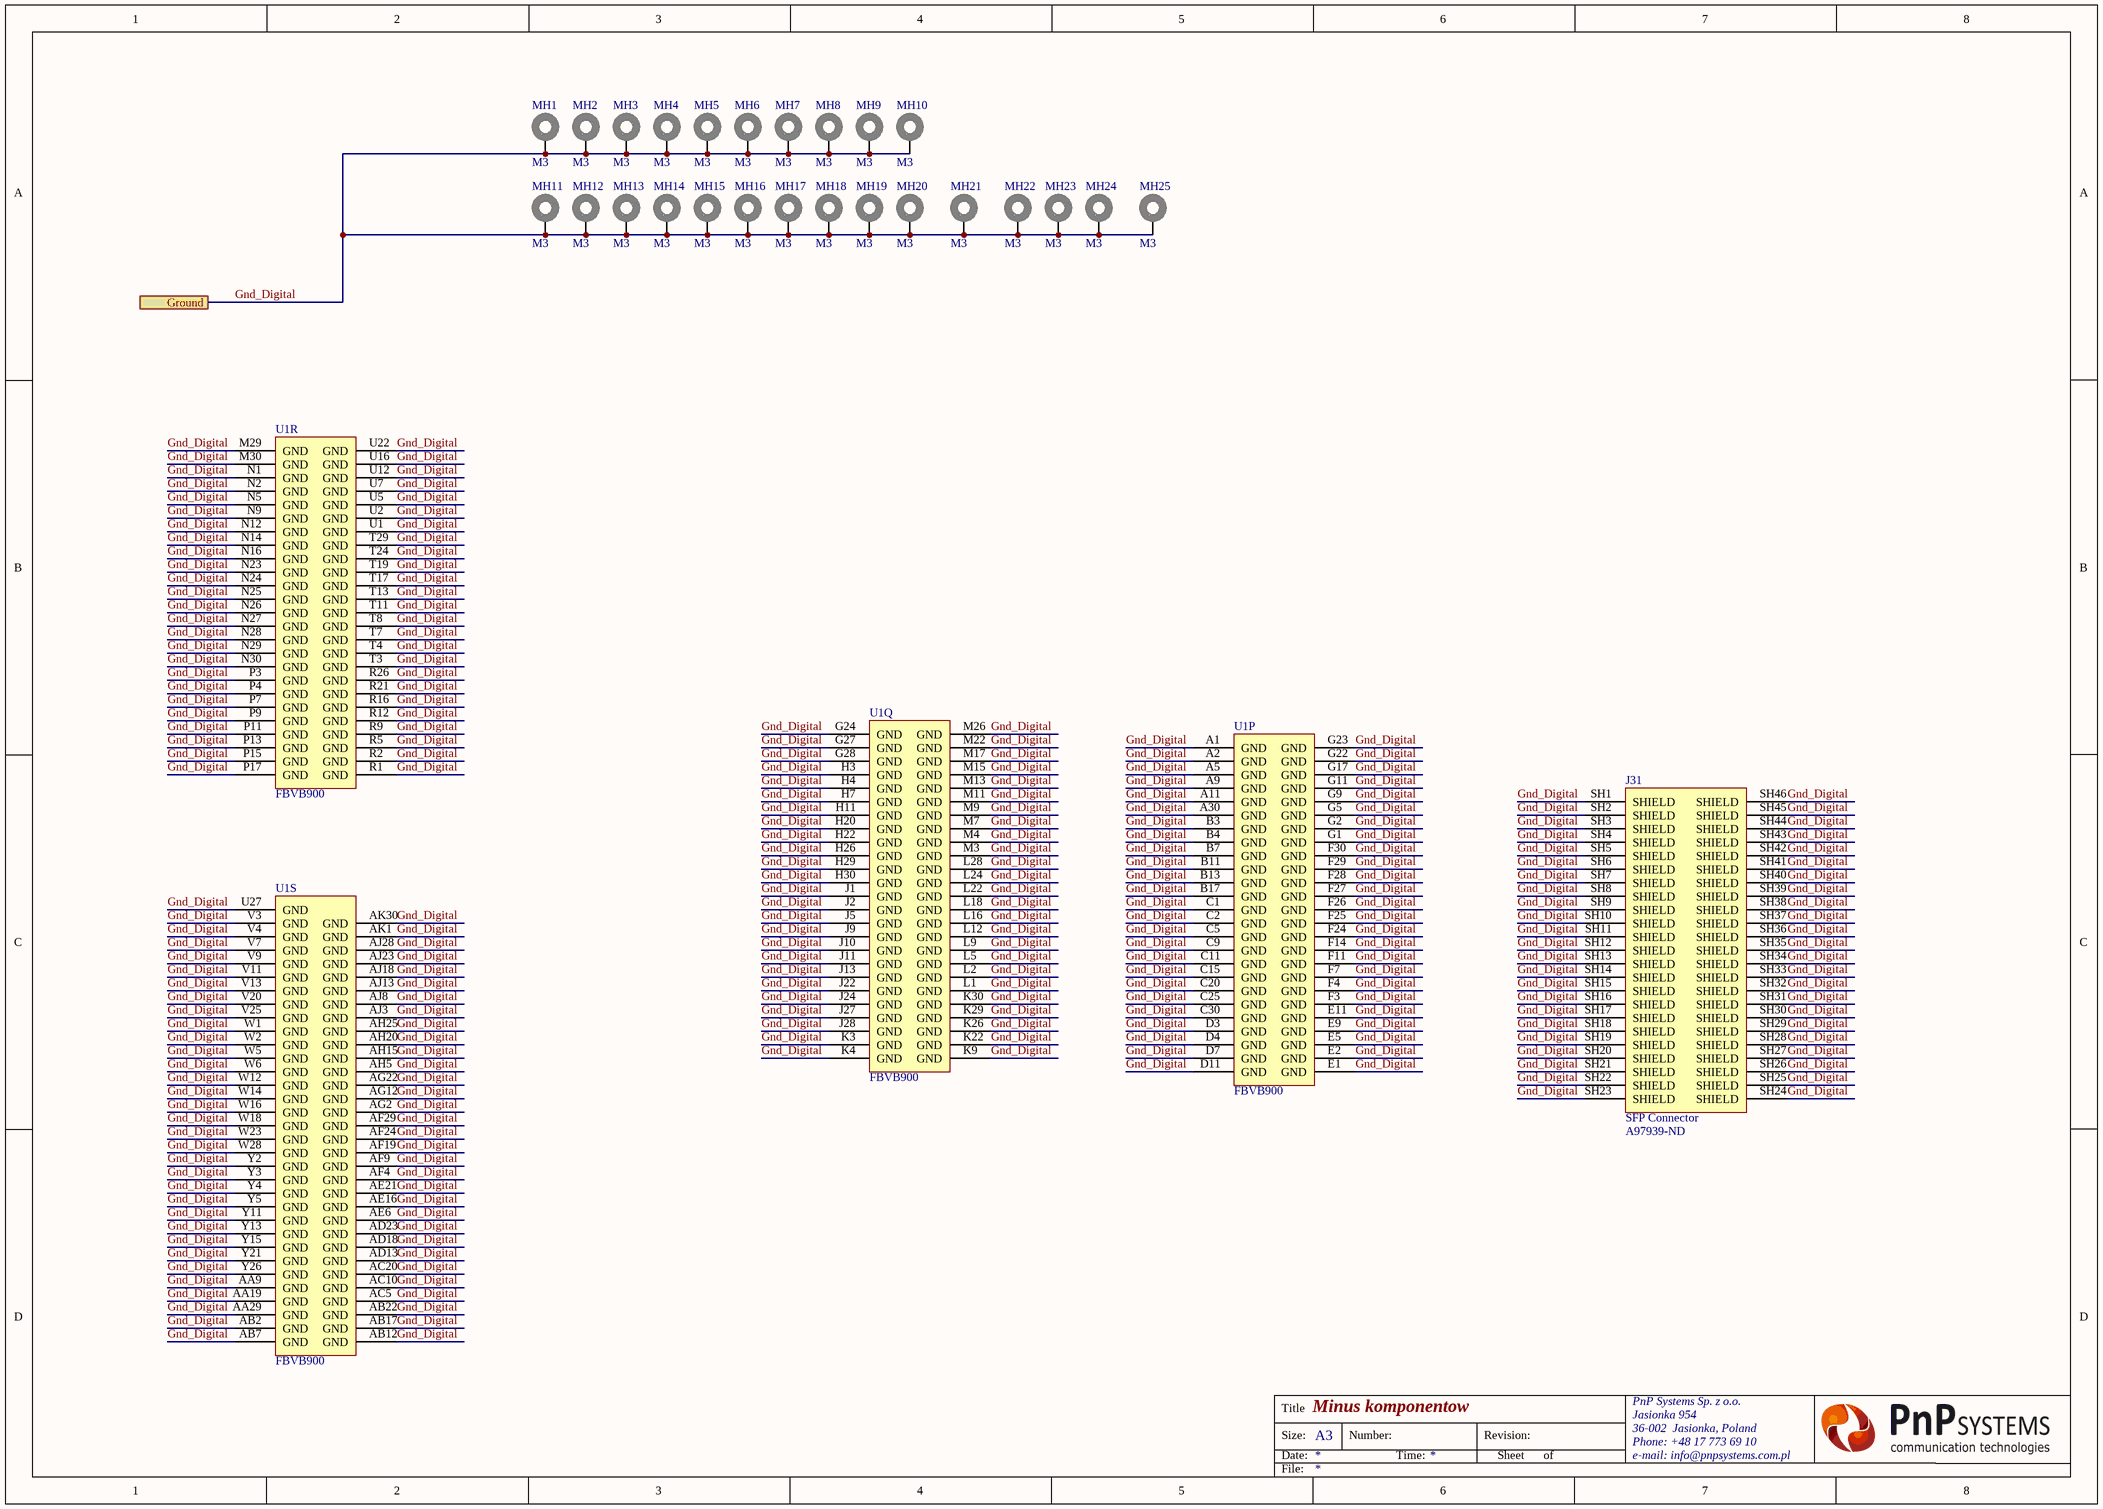
[diagram p38: Ground.SchDoc]

### Parts
J31  SFP Connector  Supplier Part Number 1: A97939-ND  [2007132]
MH1  Parameter 1: M3  [MH_5_3.2_SUB_VIA]  (hidden comment: MH_5_3.2)  (no BOM)
MH2  Parameter 1: M3  [MH_5_3.2_SUB_VIA]  (hidden comment: MH_5_3.2)  (no BOM)
MH3  Parameter 1: M3  [MH_5_3.2_SUB_VIA]  (hidden comment: MH_5_3.2)  (no BOM)
MH4  Parameter 1: M3  [MH_5_3.2_SUB_VIA]  (hidden comment: MH_5_3.2)  (no BOM)
MH5  Parameter 1: M3  [MH_5_3.2_SUB_VIA]  (hidden comment: MH_5_3.2)  (no BOM)
MH6  Parameter 1: M3  [MH_5_3.2_SUB_VIA]  (hidden comment: MH_5_3.2)  (no BOM)
MH7  Parameter 1: M3  [MH_5_3.2_SUB_VIA]  (hidden comment: MH_5_3.2)  (no BOM)
MH8  Parameter 1: M3  [MH_5_3.2_SUB_VIA]  (hidden comment: MH_5_3.2)  (no BOM)
MH9  Parameter 1: M3  [MH_5_3.2_SUB_VIA]  (hidden comment: MH_5_3.2)  (no BOM)
MH10  Parameter 1: M3  [MH_5_3.2_SUB_VIA]  (hidden comment: MH_5_3.2)  (no BOM)
MH11  Parameter 1: M3  [MH_5_3.2_SUB_VIA]  (hidden comment: MH_5_3.2)  (no BOM)
MH12  Parameter 1: M3  [MH_5_3.2_SUB_VIA]  (hidden comment: MH_5_3.2)  (no BOM)
MH13  Parameter 1: M3  [MH_5_3.2_SUB_VIA]  (hidden comment: MH_5_3.2)  (no BOM)
MH14  Parameter 1: M3  [MH_5_3.2_SUB_VIA]  (hidden comment: MH_5_3.2)  (no BOM)
MH15  Parameter 1: M3  [MH_5_3.2_SUB_VIA]  (hidden comment: MH_5_3.2)  (no BOM)
MH16  Parameter 1: M3  [MH_5_3.2_SUB_VIA]  (hidden comment: MH_5_3.2)  (no BOM)
MH17  Parameter 1: M3  [MH_5_3.2_SUB_VIA]  (hidden comment: MH_5_3.2)  (no BOM)
MH18  Parameter 1: M3  [MH_5_3.2_SUB_VIA]  (hidden comment: MH_5_3.2)  (no BOM)
MH19  Parameter 1: M3  [MH_5_3.2_SUB_VIA]  (hidden comment: MH_5_3.2)  (no BOM)
MH20  Parameter 1: M3  [MH_5_3.2_SUB_VIA]  (hidden comment: MH_5_3.2)  (no BOM)
MH21  Parameter 1: M3  [MH_5_3.2_SUB_VIA]  (hidden comment: MH_5_3.2)  (no BOM)
MH22  Parameter 1: M3  [MH_5_3.2_SUB_VIA]  (hidden comment: MH_5_3.2)  (no BOM)
MH23  Parameter 1: M3  [MH_5_3.2_SUB_VIA]  (hidden comment: MH_5_3.2)  (no BOM)
MH24  Parameter 1: M3  [MH_5_3.2_SUB_VIA]  (hidden comment: MH_5_3.2)  (no BOM)
MH25  Parameter 1: M3  [MH_5_3.2_SUB_VIA]  (hidden comment: MH_5_3.2)  (no BOM)
U1  FBVB900  [FBVB900 XX]  (parts P,Q,R,S of 23)

### Ports
Ground

### Nets
Gnd_Digital: J31.SH1(SHIELD) J31.SH2(SHIELD) J31.SH3(SHIELD) J31.SH4(SHIELD) J31.SH5(SHIELD) J31.SH6(SHIELD) J31.SH7(SHIELD) J31.SH8(SHIELD) J31.SH9(SHIELD) J31.SH10(SHIELD) J31.SH11(SHIELD) J31.SH12(SHIELD) J31.SH13(SHIELD) J31.SH14(SHIELD) J31.SH15(SHIELD) J31.SH16(SHIELD) J31.SH17(SHIELD) J31.SH18(SHIELD) J31.SH19(SHIELD) J31.SH20(SHIELD) J31.SH21(SHIELD) J31.SH22(SHIELD) J31.SH23(SHIELD) J31.SH24(SHIELD) J31.SH25(SHIELD) J31.SH26(SHIELD) J31.SH27(SHIELD) J31.SH28(SHIELD) J31.SH29(SHIELD) J31.SH30(SHIELD) J31.SH31(SHIELD) J31.SH32(SHIELD) J31.SH33(SHIELD) J31.SH34(SHIELD) J31.SH35(SHIELD) J31.SH36(SHIELD) J31.SH37(SHIELD) J31.SH38(SHIELD) J31.SH39(SHIELD) J31.SH40(SHIELD) J31.SH41(SHIELD) J31.SH42(SHIELD) J31.SH43(SHIELD) J31.SH44(SHIELD) J31.SH45(SHIELD) J31.SH46(SHIELD) MH1.1 MH2.1 MH3.1 MH4.1 MH5.1 MH6.1 MH7.1 MH8.1 MH9.1 MH10.1 MH11.1 MH12.1 MH13.1 MH14.1 MH15.1 MH16.1 MH17.1 MH18.1 MH19.1 MH20.1 MH21.1 MH22.1 MH23.1 MH24.1 MH25.1 U1.A1(GND) U1.A2(GND) U1.A5(GND) U1.A9(GND) U1.A11(GND) U1.A30(GND) U1.AA9(GND) U1.AA19(GND) U1.AA29(GND) U1.AB2(GND) U1.AB7(GND) U1.AB12(GND) U1.AB17(GND) U1.AB22(GND) U1.AC5(GND) U1.AC10(GND) U1.AC20(GND) U1.AD13(GND) U1.AD18(GND) U1.AD23(GND) U1.AE6(GND) U1.AE16(GND) U1.AE21(GND) U1.AF4(GND) U1.AF9(GND) U1.AF19(GND) U1.AF24(GND) U1.AF29(GND) U1.AG2(GND) U1.AG12(GND) U1.AG22(GND) U1.AH5(GND) U1.AH15(GND) U1.AH20(GND) U1.AH25(GND) U1.AJ3(GND) U1.AJ8(GND) U1.AJ13(GND) U1.AJ18(GND) U1.AJ23(GND) U1.AJ28(GND) U1.AK1(GND) U1.AK30(GND) U1.B3(GND) U1.B4(GND) U1.B7(GND) U1.B11(GND) U1.B13(GND) U1.B17(GND) U1.C1(GND) U1.C2(GND) U1.C5(GND) U1.C9(GND) U1.C11(GND) U1.C15(GND) U1.C20(GND) U1.C25(GND) U1.C30(GND) U1.D3(GND) U1.D4(GND) U1.D7(GND) U1.D11(GND) U1.E1(GND) U1.E2(GND) U1.E5(GND) U1.E9(GND) U1.E11(GND) U1.F3(GND) U1.F4(GND) U1.F7(GND) U1.F11(GND) U1.F14(GND) U1.F24(GND) U1.F25(GND) U1.F26(GND) U1.F27(GND) U1.F28(GND) U1.F29(GND) U1.F30(GND) U1.G1(GND) U1.G2(GND) U1.G5(GND) U1.G9(GND) U1.G11(GND) U1.G17(GND) U1.G22(GND) U1.G23(GND) U1.G24(GND) U1.G27(GND) U1.G28(GND) U1.H3(GND) U1.H4(GND) U1.H7(GND) U1.H11(GND) U1.H20(GND) U1.H22(GND) U1.H26(GND) U1.H29(GND) U1.H30(GND) U1.J1(GND) U1.J2(GND) U1.J5(GND) U1.J9(GND) U1.J10(GND) U1.J11(GND) U1.J13(GND) U1.J22(GND) U1.J24(GND) U1.J27(GND) U1.J28(GND) U1.K3(GND) U1.K4(GND) U1.K9(GND) U1.K22(GND) U1.K26(GND) U1.K29(GND) U1.K30(GND) U1.L1(GND) U1.L2(GND) U1.L5(GND) U1.L9(GND) U1.L12(GND) U1.L16(GND) U1.L18(GND) U1.L22(GND) U1.L24(GND) U1.L28(GND) U1.M3(GND) U1.M4(GND) U1.M7(GND) U1.M9(GND) U1.M11(GND) U1.M13(GND) U1.M15(GND) U1.M17(GND) U1.M22(GND) U1.M26(GND) U1.M29(GND) U1.M30(GND) U1.N1(GND) U1.N2(GND) U1.N5(GND) U1.N9(GND) U1.N12(GND) U1.N14(GND) U1.N16(GND) U1.N23(GND) U1.N24(GND) U1.N25(GND) U1.N26(GND) U1.N27(GND) U1.N28(GND) U1.N29(GND) U1.N30(GND) U1.P3(GND) U1.P4(GND) U1.P7(GND) U1.P9(GND) U1.P11(GND) U1.P13(GND) U1.P15(GND) U1.P17(GND) U1.R1(GND) U1.R2(GND) U1.R5(GND) U1.R9(GND) U1.R12(GND) U1.R16(GND) U1.R21(GND) U1.R26(GND) U1.T3(GND) U1.T4(GND) U1.T7(GND) U1.T8(GND) U1.T11(GND) U1.T13(GND) U1.T17(GND) U1.T19(GND) U1.T24(GND) U1.T29(GND) U1.U1(GND) U1.U2(GND) U1.U5(GND) U1.U7(GND) U1.U12(GND) U1.U16(GND) U1.U22(GND) U1.U27(GND) U1.V3(GND) U1.V4(GND) U1.V7(GND) U1.V9(GND) U1.V11(GND) U1.V13(GND) U1.V20(GND) U1.V25(GND) U1.W1(GND) U1.W2(GND) U1.W5(GND) U1.W6(GND) U1.W12(GND) U1.W14(GND) U1.W16(GND) U1.W18(GND) U1.W23(GND) U1.W28(GND) U1.Y2(GND) U1.Y3(GND) U1.Y4(GND) U1.Y5(GND) U1.Y11(GND) U1.Y13(GND) U1.Y15(GND) U1.Y21(GND) U1.Y26(GND) ; port Ground  [project net B503_Ground]

### Notes on the sheet
- Title
- Size:
- Date:
- A3
- Number:
- Time:
- Revision:
- Sheet
- of
- File:

### Library data of the parts
J31 = 2007132: Manufacturer: TE Connectivity; Manufacturer Part Number: 2007132-1; Gender: Female; Number of Ports: 4; Data Rate: 16Gbps; PCB Thickness: 2.25mm; Tail Length: 2.05mm; Supplier 1: Digi-Key; Stock 1: 509; Pricing 1: 1 = 12,92000, 10 = 11,74600, 25 = 11,45240, 50 = 10,57140, 100 = 9,98410, 250 = 9,10312, 500 = 8,51582, 1000 = 7,81106 (USD); RoHS: Yes; Mount: Through Hole; Material: Silver; Housing Material: Silver; Packaging: Tray; Package Quantity: 16; Termination: Press-Fit; Connector Type: SFP; Orientation: Right Angle; Features: Shielded; Length: 57.25mm; Depth: 47.8mm; Radiation Hardening: No; Lead Free: Not Applicable; REACH SVHC: No SVHC; ELV: Compliant; Flammability Rating: UL94 V-0; ComponentLink1URL: https://datasheet.ciiva.com/8074/1702641-8074723.pdf?src-supplier=Element14; ComponentLink1Description: https://datasheet.ciiva.com/8074/1702641-8074723.pdf?src-supplier=Element14; ComponentLink2URL: https://datasheet.ciiva.com/16354/2007132-1-16354359.pdf?src-supplier=Future+Electronics; ComponentLink2Description: https://datasheet.ciiva.com/16354/2007132-1-16354359.pdf?src-supplier=Future+Electronics; ComponentLink3URL: https://datasheet.ciiva.com/1447/1744756-1447853.pdf?src-supplier=Newark; ComponentLink3Description: https://datasheet.ciiva.com/1447/1744756-1447853.pdf?src-supplier=Newark; ComponentLink4URL: https://datasheet.ciiva.com/689/eng-cd-2007132-d1-pdf-2007132-c-drw-689518.pdf?src-supplier=Digi-Key; ComponentLink4Description: https://datasheet.ciiva.com/689/eng-cd-2007132-d1-pdf-2007132-c-drw-689518.pdf?src-supplier=Digi-Key; ComponentLink5URL: https://datasheet.ciiva.com/3093/eng-cs-1773408-1-pluggable-ixo-solutions-sfp2b-0209-3093041.pdf?src-supplier=Avnet; ComponentLink5Description: https://datasheet.ciiva.com/3093/eng-cs-1773408-1-pluggable-ixo-solutions-sfp2b-0209-3093041.pdf?src-supplier=Avnet; ComponentLink6URL: https://datasheet.ciiva.com/30089/o-solut-30089223.pdf?src-supplier=Onlinecomponents.com; ComponentLink6Description: https://datasheet.ciiva.com/30089/o-solut-30089223.pdf?src-supplier=Onlinecomponents.com; ComponentLink7URL: https://datasheet.ciiva.com/16775/eng-cs-1773408-1-pluggable-ixo-solutions-sfp2b-0209-16775672.pdf?src-supplier=Avnet+Europe; ComponentLink7Description: https://datasheet.ciiva.com/16775/eng-cs-1773408-1-pluggable-ixo-solutions-sfp2b-0209-16775672.pdf?src-supplier=Avnet+Europe
MH1-MH25 = MH_5_3.2: Mounting Holes_5_3.2
U1 = FBVB900: as U1 on sheet XilinxPower; Supplier 1: Mouser; Supplier Part Number 1: 217-CZU4CG-1FBVB900E; Stock 1: 3; Pricing 1: 1=0,00000, 5=1060,70000 (USD); RoHS: No; Case/Package: FCBGA; Min Operating Temperature: 0°C; Max Operating Temperature: 100°C; Packaging: Tray; ComponentLink1URL: https://www.xilinx.com/support/documentation/data_sheets/ds891-zynq-ultrascale-plus-overview.pdf?src-supplier=Digi-Key; ComponentLink1Description: https://www.xilinx.com/support/documentation/data_sheets/ds891-zynq-ultrascale-plus-overview.pdf?src-supplier=Digi-Key; ComponentLink2URL: https://www.xilinx.com/support/documentation/data_sheets/ds925-zynq-ultrascale-plus.pdf?src-supplier=Digi-Key; ComponentLink2Description: https://www.xilinx.com/support/documentation/data_sheets/ds925-zynq-ultrascale-plus.pdf?src-supplier=Digi-Key; Supplier 2: Avnet; Supplier 3: Digi-Key; Supplier Part Number 2: XCZU4CG-1FBVB900E; Supplier Part Number 3: XCZU4CG-1FBVB900E-ND